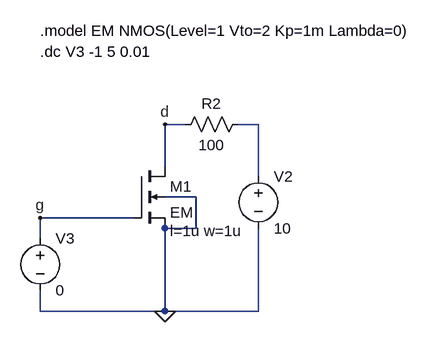
[diagram p0: schematic Ex06.asc]
Ex06.asc, the LTspice schematic file:
Version 4.1
SHEET 1 1200 800
WIRE 224 32 192 32
WIRE 336 32 304 32
WIRE 192 96 192 32
WIRE 336 112 336 32
WIRE 240 144 192 144
WIRE 144 176 0 176
WIRE 240 192 240 144
WIRE 240 192 192 192
WIRE 0 208 0 176
WIRE 0 320 0 288
WIRE 192 320 192 192
WIRE 192 320 0 320
WIRE 336 320 336 192
WIRE 336 320 192 320
FLAG 192 320 0
FLAG 192 32 d
FLAG 0 176 g
SYMBOL nmos4 144 96 R0
WINDOW 39 56 100 Left 2
SYMATTR SpiceLine l=1u w=1u
SYMATTR InstName M1
SYMATTR Value EM
SYMBOL voltage 0 192 R0
SYMATTR InstName V3
SYMATTR Value 0
SYMBOL voltage 336 96 R0
SYMATTR InstName V2
SYMATTR Value 10
SYMBOL res 320 16 R90
WINDOW 0 0 56 VBottom 2
WINDOW 3 32 56 VTop 2
SYMATTR InstName R2
SYMATTR Value 100
TEXT 0 -112 Left 2 !.model EM NMOS(Level=1 Vto=2 Kp=1m Lambda=0)
TEXT 0 -80 Left 2 !.dc V3 -1 5 0.01

The netlist it stands for:
* Ex06.asc
M1 d g 0 0 EM l=1u w=1u
V3 g 0 0
V2 N001 0 10
R2 N001 d 100
.model NMOS NMOS
.model PMOS PMOS
.lib standard.mos
.model EM NMOS(Level=1 Vto=2 Kp=1m Lambda=0)
.dc V3 -1 5 0.01
.backanno
.end